# Altium schematic sheet Ext_GPIO_Bank0.SchDoc
size A3
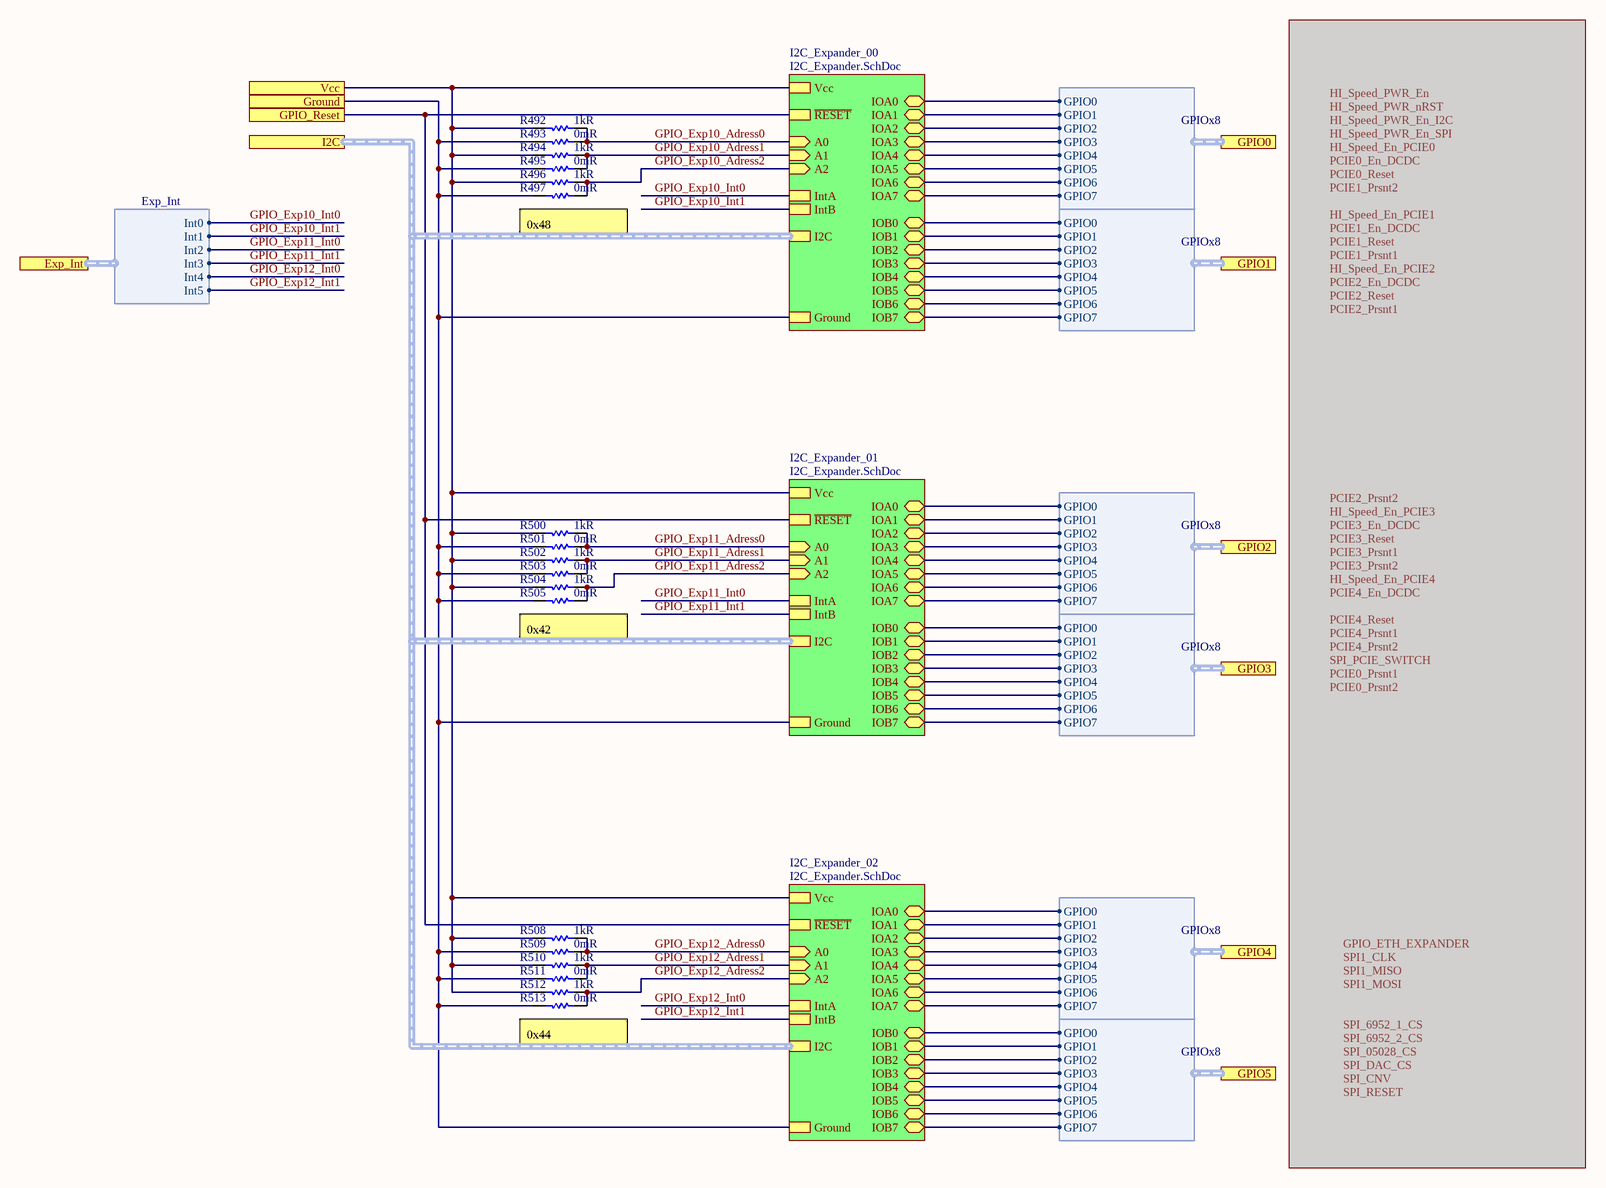
[diagram p0: Ext_GPIO_Bank0.SchDoc]

## Parts
R492  1kR  [RES 0402/1005 RF KK]
R493  0mR  [RES 0402/1005 RF KK]
R494  1kR  [RES 0402/1005 RF KK]
R495  0mR  [RES 0402/1005 RF KK]
R496  1kR  [RES 0402/1005 RF KK]
R497  0mR  [RES 0402/1005 RF KK]
R500  1kR  [RES 0402/1005 RF KK]
R501  0mR  [RES 0402/1005 RF KK]
R502  1kR  [RES 0402/1005 RF KK]
R503  0mR  [RES 0402/1005 RF KK]
R504  1kR  [RES 0402/1005 RF KK]
R505  0mR  [RES 0402/1005 RF KK]
R508  1kR  [RES 0402/1005 RF KK]
R509  0mR  [RES 0402/1005 RF KK]
R510  1kR  [RES 0402/1005 RF KK]
R511  0mR  [RES 0402/1005 RF KK]
R512  1kR  [RES 0402/1005 RF KK]
R513  0mR  [RES 0402/1005 RF KK]

## Sub-sheets
I2C_Expander_00 = I2C_Expander.SchDoc: IOA7 (bidir), IOA3 (bidir), IOA6 (bidir), IOA1 (bidir), IOA0 (bidir), IOA5 (bidir), IOB1 (bidir), IOB2 (bidir), IOB5 (bidir), IOB6 (bidir), IOB7 (bidir), IntA, IntB, Ground, IOB4 (bidir), IOB3 (bidir), IOA2 (bidir), IOA4 (bidir), IOB0 (bidir), Vcc, ~{RESET}, I2C (harness I2C), A2 (in), A1 (in), A0 (in)
I2C_Expander_01 = I2C_Expander.SchDoc: IOA7 (bidir), IOA3 (bidir), IOA6 (bidir), IOA1 (bidir), IOA0 (bidir), IOA5 (bidir), IOB1 (bidir), IOB2 (bidir), IOB5 (bidir), IOB6 (bidir), IOB7 (bidir), IntA, IntB, Ground, IOB4 (bidir), IOB3 (bidir), IOA2 (bidir), IOA4 (bidir), IOB0 (bidir), Vcc, ~{RESET}, I2C (harness I2C), A2 (in), A1 (in), A0 (in)
I2C_Expander_02 = I2C_Expander.SchDoc: IOA7 (bidir), IOA3 (bidir), IOA6 (bidir), IOA1 (bidir), IOA0 (bidir), IOA5 (bidir), IOB1 (bidir), IOB2 (bidir), IOB5 (bidir), IOB6 (bidir), IOB7 (bidir), IntA, IntB, Ground, IOB4 (bidir), IOB3 (bidir), IOA2 (bidir), IOA4 (bidir), IOB0 (bidir), Vcc, ~{RESET}, I2C (harness I2C), A2 (in), A1 (in), A0 (in)

## Ports
Exp_Int (harness Exp_Int), GPIO0 (harness GPIOx8), GPIO1 (harness GPIOx8), GPIO2 (harness GPIOx8), GPIO3 (harness GPIOx8), GPIO4 (harness GPIOx8), GPIO5 (harness GPIOx8), GPIO_Reset, Ground, I2C (harness I2C), Vcc

## Harnesses
GPIOx8: GPIO0, GPIO1, GPIO2, GPIO3, GPIO4, GPIO5, GPIO6, GPIO7
Exp_Int: Int0, Int1, Int2, Int3, Int4, Int5

## Nets
GPIO_Exp10_Adress0: R492.2 R493.1 ; sheet I2C_Expander_00/A0
GPIO_Exp10_Adress1: R494.2 R495.1 ; sheet I2C_Expander_00/A1
GPIO_Exp10_Adress2: R496.2 R497.1 ; sheet I2C_Expander_00/A2
GPIO_Exp10_Int0: sheet I2C_Expander_00/IntA, port Exp_Int.Int0
GPIO_Exp10_Int1: sheet I2C_Expander_00/IntB, port Exp_Int.Int1
GPIO_Exp11_Adress0: R500.2 R501.1 ; sheet I2C_Expander_01/A0
GPIO_Exp11_Adress1: R502.2 R503.1 ; sheet I2C_Expander_01/A1
GPIO_Exp11_Adress2: R504.2 R505.1 ; sheet I2C_Expander_01/A2
GPIO_Exp11_Int0: sheet I2C_Expander_01/IntA, port Exp_Int.Int2
GPIO_Exp11_Int1: sheet I2C_Expander_01/IntB, port Exp_Int.Int3
GPIO_Exp12_Adress0: R508.2 R509.1 ; sheet I2C_Expander_02/A0
GPIO_Exp12_Adress1: R510.2 R511.1 ; sheet I2C_Expander_02/A1
GPIO_Exp12_Adress2: R512.2 R513.1 ; sheet I2C_Expander_02/A2
GPIO_Exp12_Int0: sheet I2C_Expander_02/IntA, port Exp_Int.Int4
GPIO_Exp12_Int1: sheet I2C_Expander_02/IntB, port Exp_Int.Int5
GPIO_Reset: port GPIO_Reset, sheet I2C_Expander_00/~{RESET}, sheet I2C_Expander_01/~{RESET}, sheet I2C_Expander_02/~{RESET}
Ground: R493.2 R495.2 R497.2 R501.2 R503.2 R505.2 R509.2 R511.2 R513.2 ; port Ground, sheet I2C_Expander_00/Ground, sheet I2C_Expander_01/Ground, sheet I2C_Expander_02/Ground
Vcc: R492.1 R494.1 R496.1 R500.1 R502.1 R504.1 R508.1 R510.1 R512.1 ; port Vcc, sheet I2C_Expander_00/Vcc, sheet I2C_Expander_01/Vcc, sheet I2C_Expander_02/Vcc
(unnamed): sheet I2C_Expander_00/IOA7, port GPIO0.GPIO7
(unnamed): sheet I2C_Expander_00/IOA3, port GPIO0.GPIO3
(unnamed): sheet I2C_Expander_00/IOA6, port GPIO0.GPIO6
(unnamed): sheet I2C_Expander_00/IOA1, port GPIO0.GPIO1
(unnamed): sheet I2C_Expander_00/IOA0, port GPIO0.GPIO0
(unnamed): sheet I2C_Expander_00/IOA5, port GPIO0.GPIO5
(unnamed): sheet I2C_Expander_00/IOB1, port GPIO1.GPIO1
(unnamed): sheet I2C_Expander_00/IOB2, port GPIO1.GPIO2
(unnamed): sheet I2C_Expander_00/IOB5, port GPIO1.GPIO5
(unnamed): sheet I2C_Expander_00/IOB6, port GPIO1.GPIO6
(unnamed): sheet I2C_Expander_00/IOB7, port GPIO1.GPIO7
(unnamed): sheet I2C_Expander_00/IOB4, port GPIO1.GPIO4
(unnamed): sheet I2C_Expander_00/IOB3, port GPIO1.GPIO3
(unnamed): sheet I2C_Expander_00/IOA2, port GPIO0.GPIO2
(unnamed): sheet I2C_Expander_00/IOA4, port GPIO0.GPIO4
(unnamed): sheet I2C_Expander_00/IOB0, port GPIO1.GPIO0
(unnamed): sheet I2C_Expander_01/IOA7, port GPIO2.GPIO7
(unnamed): sheet I2C_Expander_01/IOA3, port GPIO2.GPIO3
(unnamed): sheet I2C_Expander_01/IOA6, port GPIO2.GPIO6
(unnamed): sheet I2C_Expander_01/IOA1, port GPIO2.GPIO1
(unnamed): sheet I2C_Expander_01/IOA0, port GPIO2.GPIO0
(unnamed): sheet I2C_Expander_01/IOA5, port GPIO2.GPIO5
(unnamed): sheet I2C_Expander_01/IOB1, port GPIO3.GPIO1
(unnamed): sheet I2C_Expander_01/IOB2, port GPIO3.GPIO2
(unnamed): sheet I2C_Expander_01/IOB5, port GPIO3.GPIO5
(unnamed): sheet I2C_Expander_01/IOB6, port GPIO3.GPIO6
(unnamed): sheet I2C_Expander_01/IOB7, port GPIO3.GPIO7
(unnamed): sheet I2C_Expander_01/IOB4, port GPIO3.GPIO4
(unnamed): sheet I2C_Expander_01/IOB3, port GPIO3.GPIO3
(unnamed): sheet I2C_Expander_01/IOA2, port GPIO2.GPIO2
(unnamed): sheet I2C_Expander_01/IOA4, port GPIO2.GPIO4
(unnamed): sheet I2C_Expander_01/IOB0, port GPIO3.GPIO0
(unnamed): sheet I2C_Expander_02/IOA7, port GPIO4.GPIO7
(unnamed): sheet I2C_Expander_02/IOA3, port GPIO4.GPIO3
(unnamed): sheet I2C_Expander_02/IOA6, port GPIO4.GPIO6
(unnamed): sheet I2C_Expander_02/IOA1, port GPIO4.GPIO1
(unnamed): sheet I2C_Expander_02/IOA0, port GPIO4.GPIO0
(unnamed): sheet I2C_Expander_02/IOA5, port GPIO4.GPIO5
(unnamed): sheet I2C_Expander_02/IOB1, port GPIO5.GPIO1
(unnamed): sheet I2C_Expander_02/IOB2, port GPIO5.GPIO2
(unnamed): sheet I2C_Expander_02/IOB5, port GPIO5.GPIO5
(unnamed): sheet I2C_Expander_02/IOB6, port GPIO5.GPIO6
(unnamed): sheet I2C_Expander_02/IOB7, port GPIO5.GPIO7
(unnamed): sheet I2C_Expander_02/IOB4, port GPIO5.GPIO4
(unnamed): sheet I2C_Expander_02/IOB3, port GPIO5.GPIO3
(unnamed): sheet I2C_Expander_02/IOA2, port GPIO4.GPIO2
(unnamed): sheet I2C_Expander_02/IOA4, port GPIO4.GPIO4
(unnamed): sheet I2C_Expander_02/IOB0, port GPIO5.GPIO0

## Buses and harness runs
harness port I2C = sheet I2C_Expander_00/I2C = sheet I2C_Expander_01/I2C = sheet I2C_Expander_02/I2C

## Notes on the sheet
- (near R497) 0x48
- (near R505) 0x42
- (near R513) 0x44
- Title
- Size:
- Date:
- A3
- Number:
- Time:
- Revision:
- Sheet
- of
- File:

## Library data of the parts
R492 R494 R496 R500 R502 R504 R508 R510 R512 = Resistor: PANASONIC - ERJ-2RKF1001X - SMD Chip Resistor, 0402 [1005 Metric], 1 kohm, ERJ2R Series, 50 V, Thick Film, 100 mW; Temperature Coefficient: 100ppm/°C; Tolerance: 1%; Voltage Rating (DC): 50V; Power Rating: 100mW; Supplier 1: Digi-Key; Supplier Part Number 1: P1.00KLDKR-ND; Manufacturer: Panasonic; Manufacturer Part Number: ERJ-2RKF1001X; RoHS: Yes; Category: Chip SMD Resistors; Stock 1: 1864188; Pricing 1: 1=0,10000, 10=0,04300, 100=0,01740, 1000=0,00782, 2500=0,00678, 5000=0,00561 (USD); Mount: Surface Mount; Case/Package: 0402; Number of Pins: 2; Contact Plating: Tin; Case Code (Imperial): 0402; Case Code (Metric): 1005; Min Operating Temperature: -55°C; Max Operating Temperature: 155°C; Composition: Thick Film; Resistance: 1kR; Termination: SMD/SMT; Number of Terminations: 2; Military Standard: Not; Features: Automotive AEC-Q200; Packaging: Tape and Reel; Voltage Rating: 50V; Package Quantity: 1; Max Power Dissipation: 100mW; Working Voltage: 50V; Length: 1mm; Height: 0.35mm; Depth: 0.5mm; Width: 0.5mm; Radiation Hardening: No; Lead Free: Lead Free; REACH SVHC: No SVHC; ComponentLink1URL: https://datasheet.ciiva.com/11821/0900766b80f80784-11821203.pdf?src-supplier=RSComponents; ComponentLink1Description: https://datasheet.ciiva.com/11821/0900766b80f80784-11821203.pdf?src-supplier=RSComponents; ComponentLink2URL: https://datasheet.ciiva.com/7942/aoa0000ce2-7942426.pdf?src-supplier=Element14; ComponentLink2Description: https://datasheet.ciiva.com/7942/aoa0000ce2-7942426.pdf?src-supplier=Element14; ComponentLink3URL: https://datasheet.ciiva.com/16523/aoa0000ce2-16523834.pdf?src-supplier=Avnet+Asia; ComponentLink3Description: https://datasheet.ciiva.com/16523/aoa0000ce2-16523834.pdf?src-supplier=Avnet+Asia; ComponentLink4URL: https://datasheet.ciiva.com/17215/aoa0000ce2-17215308.pdf?src-supplier=Avnet+Europe; ComponentLink4Description: https://datasheet.ciiva.com/17215/aoa0000ce2-17215308.pdf?src-supplier=Avnet+Europe; ComponentLink5URL: https://datasheet.ciiva.com/22673/1678782-22673916.pdf?src-supplier=Element14; ComponentLink5Description: https://datasheet.ciiva.com/22673/1678782-22673916.pdf?src-supplier=Element14; ComponentLink6URL: https://datasheet.ciiva.com/28532/1678782-28532109.pdf?src-supplier=Element14; ComponentLink6Description: https://datasheet.ciiva.com/28532/1678782-28532109.pdf?src-supplier=Element14; ComponentLink7URL: https://datasheet.ciiva.com/16767/70260748-16767559.pdf?src-supplier=Allied+Electronics; ComponentLink7Description: https://datasheet.ciiva.com/16767/70260748-16767559.pdf?src-supplier=Allied+Electronics; ComponentLink8URL: https://datasheet.ciiva.com/9198/aoa0000ce2-9198920.pdf?src-supplier=Avnet; ComponentLink8Description: https://datasheet.ciiva.com/9198/aoa0000ce2-9198920.pdf?src-supplier=Avnet; ComponentLink9URL: https://datasheet.ciiva.com/16771/70260748-16771979.pdf?src-supplier=Allied+Electronics; ComponentLink9Description: https://datasheet.ciiva.com/16771/70260748-16771979.pdf?src-supplier=Allied+Electronics
R493 R495 R497 R501 R503 R505 R509 R511 R513 = Resistor: Manufacturer 1: Yageo; Manufacturer Part Number 1: RC0402JR-070RL; Power Rating: 62.5mW; Tolerance: 5%; Voltage Rating: 50V; Max Power Dissipation: 63mW; Temperature Coefficient: 200ppm/°C; Supplier 1: Digi-Key; Supplier Part Number 1: 311-0.0JRCT-ND; Stock 1: 69822252; Pricing 1: 1=0.10000, 10=0.01200, 25=0.00920, 50=0.00680, 100=0.00510, 250=0.00388, 500=0.00308, 1000=0.00227, 5000=0.00163 (USD); RoHS: Yes; Case/Package: 0402; Contact Plating: Tin,Matte; Case Code (Metric): 1005; Case Code (Imperial): 0402; Min Operating Temperature: -55°C; Max Operating Temperature: 155°C; Resistance: 0mR; Packaging: Tape and Reel; Composition: Thick Film; Package Quantity: 1; Number of Terminations: 2; Termination: SMD/SMT; Military Standard: Not; Features: Moisture Resistant; Length: 1mm; Height: 0.016inch; Width: 0.02inch; Depth: 0.5mm; Radiation Hardening: No; REACH SVHC: Unknown; Lead Free: Lead Free; ComponentLink1URL: https://datasheet.ciiva.com/2452/pyu-rc0402-51-rohs-l-6-2452608.pdf?src-supplier=Digi-Key; ComponentLink1Description: https://datasheet.ciiva.com/2452/pyu-rc0402-51-rohs-l-6-2452608.pdf?src-supplier=Digi-Key; ComponentLink2URL: https://datasheet.ciiva.com/11808/0900766b80c66297-11808195.pdf?src-supplier=RSComponents; ComponentLink2Description: https://datasheet.ciiva.com/11808/0900766b80c66297-11808195.pdf?src-supplier=RSComponents; ComponentLink3URL: https://datasheet.ciiva.com/2452/pyu-r-int-thick-7-2452609.pdf?src-supplier=Digi-Key; ComponentLink3Description: https://datasheet.ciiva.com/2452/pyu-r-int-thick-7-2452609.pdf?src-supplier=Digi-Key; ComponentLink4URL: https://datasheet.ciiva.com/22747/1018594-22747515.pdf?src-supplier=Element14; ComponentLink4Description: https://datasheet.ciiva.com/22747/1018594-22747515.pdf?src-supplier=Element14; ComponentLink5URL: https://datasheet.ciiva.com/7983/1018594-7983535.pdf?src-supplier=Element14; ComponentLink5Description: https://datasheet.ciiva.com/7983/1018594-7983535.pdf?src-supplier=Element14; ComponentLink6URL: https://datasheet.ciiva.com/2452/pyu-r-int-thick-7-2452610.pdf?src-supplier=Digi-Key; ComponentLink6Description: https://datasheet.ciiva.com/2452/pyu-r-int-thick-7-2452610.pdf?src-supplier=Digi-Key; ComponentLink7URL: https://datasheet.ciiva.com/8896/pyu-rc0402-51-rohs-l-6-8896201.pdf?src-supplier=Avnet; ComponentLink7Description: https://datasheet.ciiva.com/8896/pyu-rc0402-51-rohs-l-6-8896201.pdf?src-supplier=Avnet; ComponentLink8URL: https://datasheet.ciiva.com/28386/pyu-rc0402-51-rohs-l-6-28386633.pdf?src-supplier=Avnet+Europe; ComponentLink8Description: https://datasheet.ciiva.com/28386/pyu-rc0402-51-rohs-l-6-28386633.pdf?src-supplier=Avnet+Europe; ComponentLink9URL: https://datasheet.ciiva.com/15189/getdatasheetpartid-326379-15189533.pdf?src-supplier=Verical; ComponentLink9Description: https://datasheet.ciiva.com/15189/getdatasheetpartid-326379-15189533.pdf?src-supplier=Verical